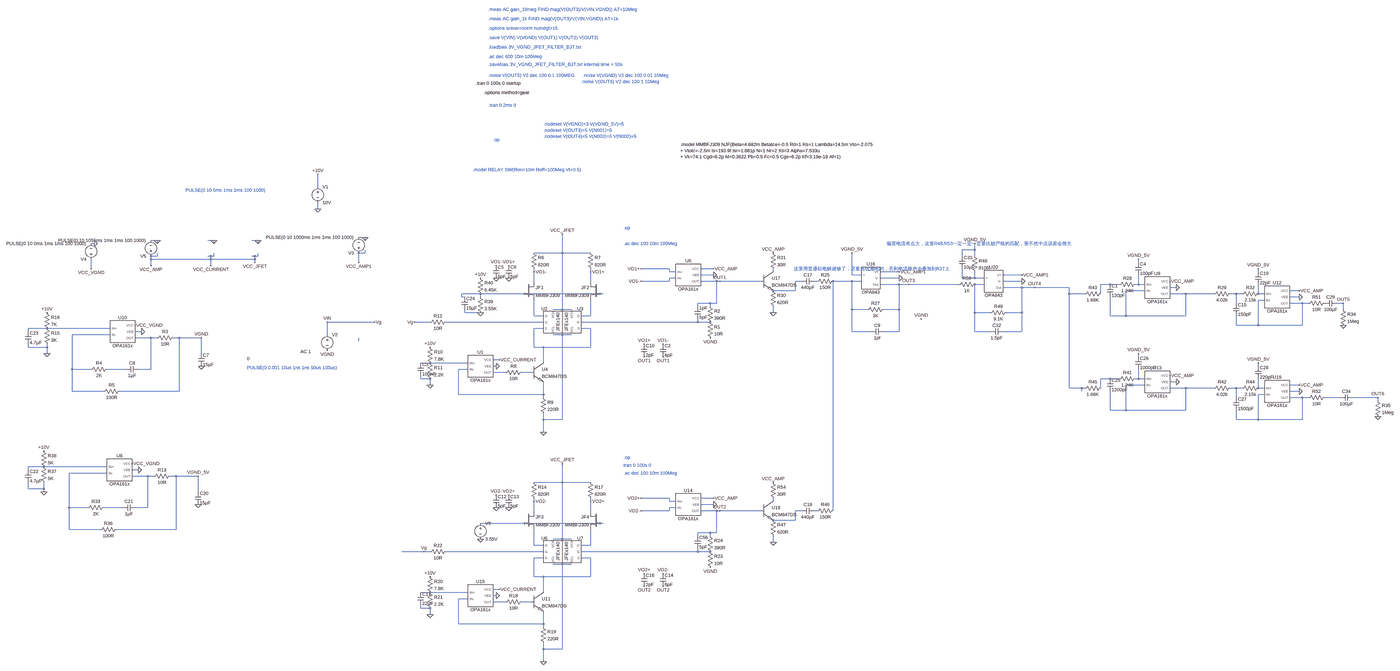
[diagram p0: schematic 3V_VGND__JFET_CASCODE_BJT.asc, whole sheet]
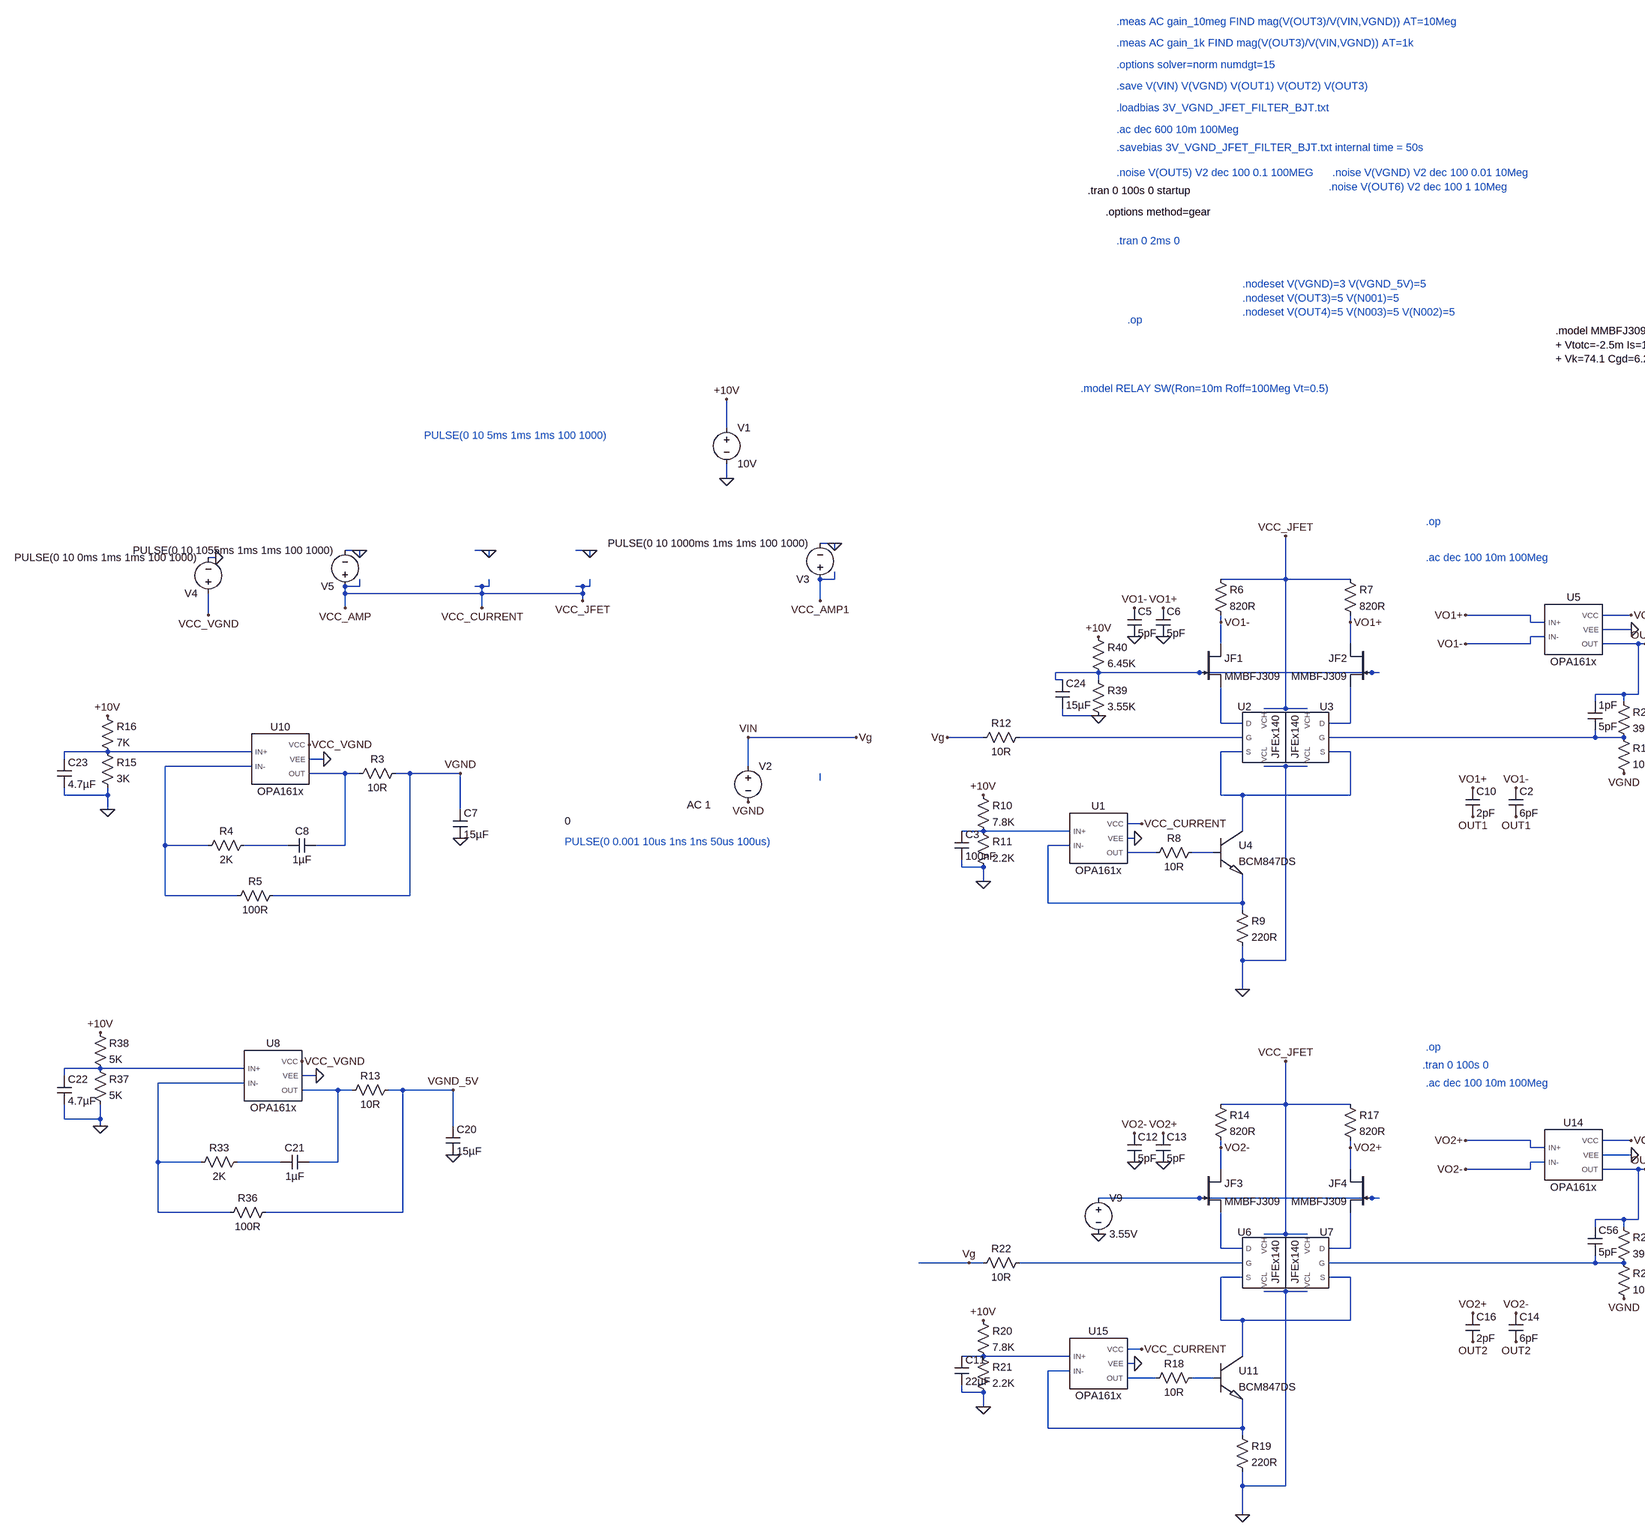
[diagram p1: schematic 3V_VGND__JFET_CASCODE_BJT.asc, part, row 1 of 1, column 1 of 2]
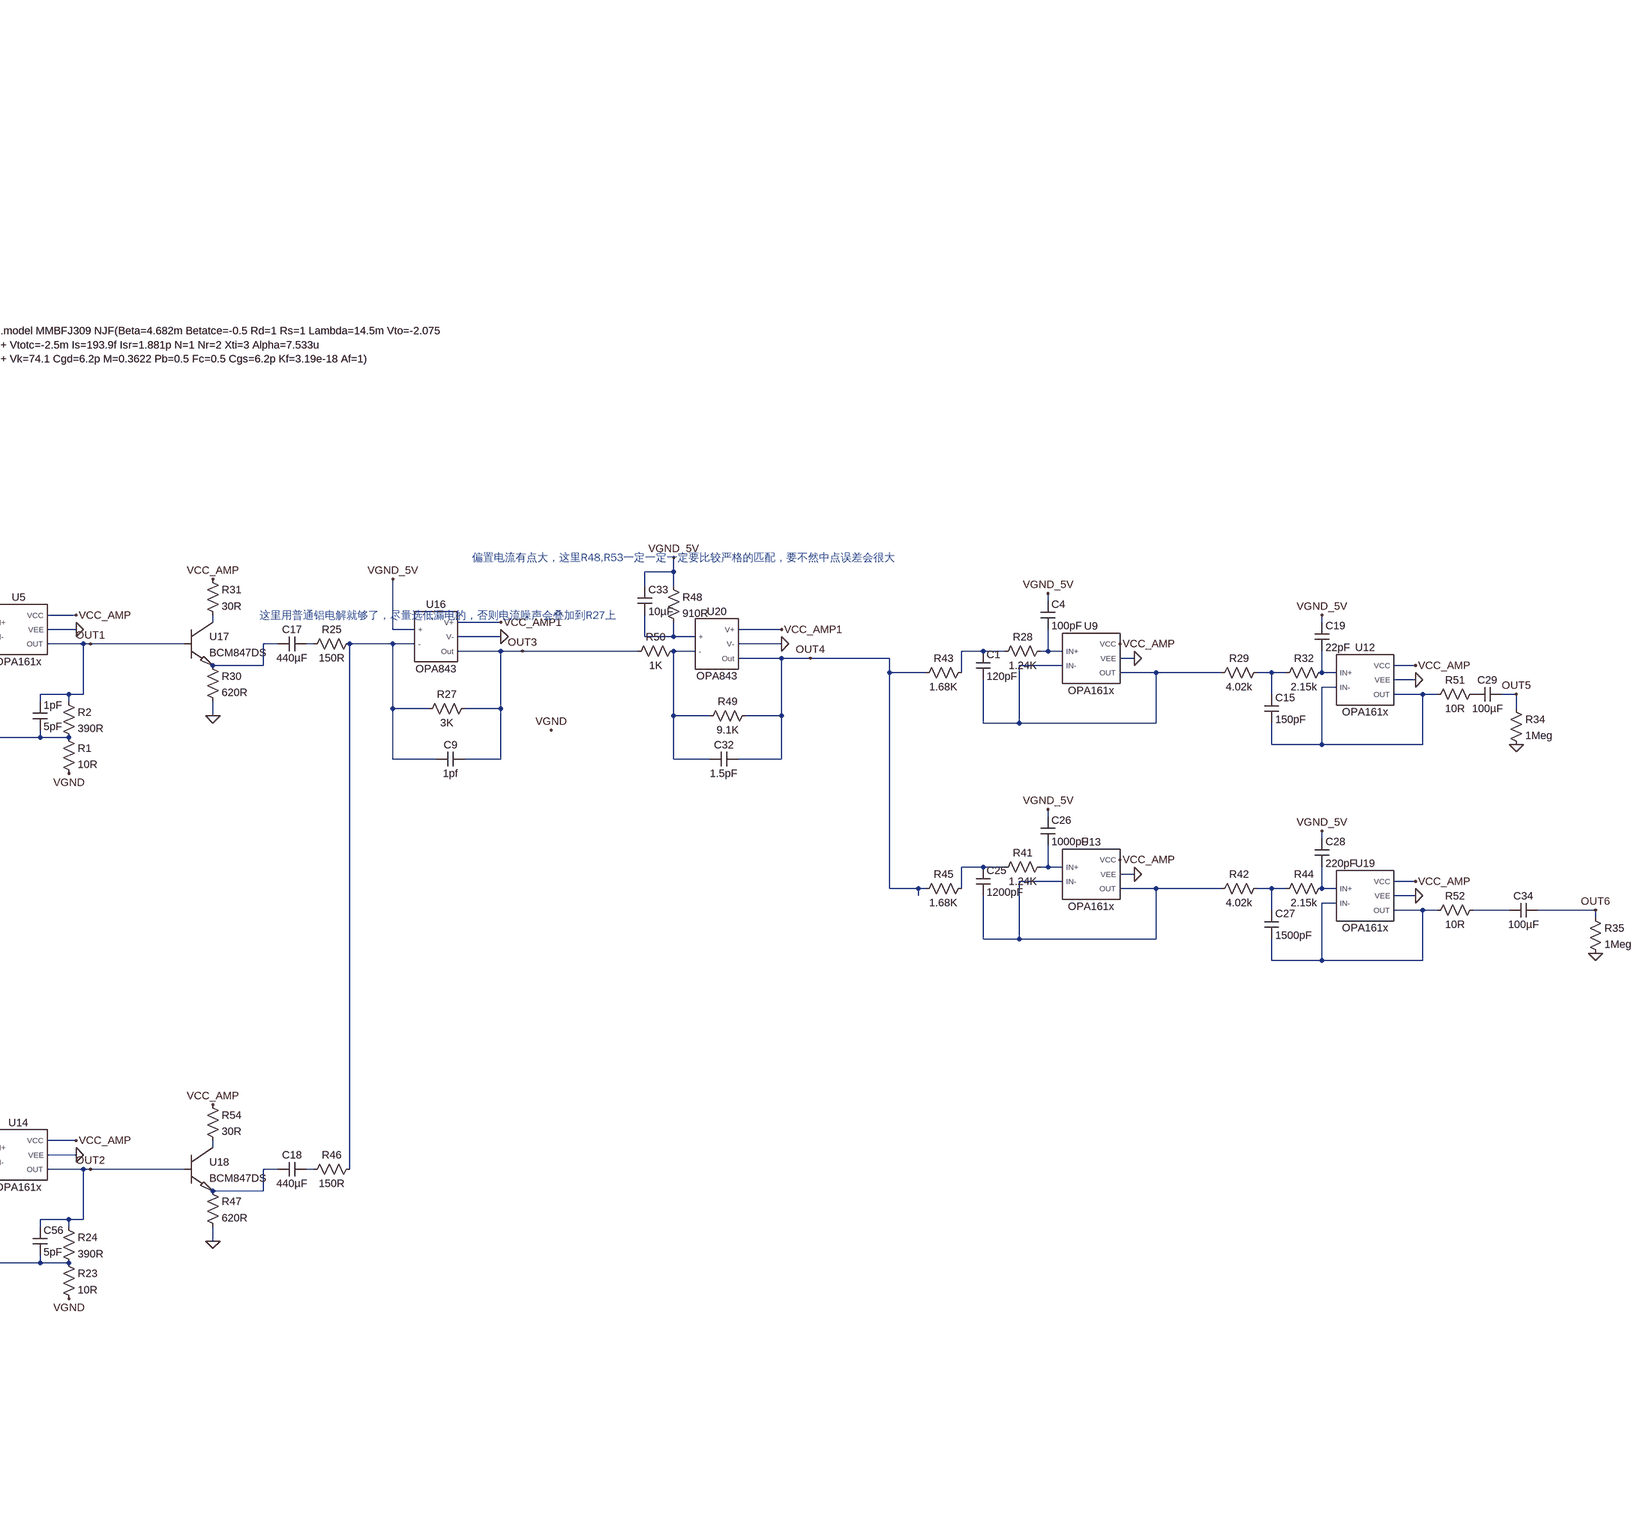
[diagram p2: schematic 3V_VGND__JFET_CASCODE_BJT.asc, part, row 1 of 1, column 2 of 2]
3V_VGND__JFET_CASCODE_BJT.asc, the LTspice schematic file:
Version 4.1
SHEET 1 3736 4404
WIRE -1888 -272 -1888 -336
WIRE -1888 -160 -1888 -192
WIRE -1648 -16 -1680 -16
WIRE -2704 0 -2736 0
WIRE -2416 0 -2448 0
WIRE -2192 0 -2224 0
WIRE -1648 0 -1648 -16
WIRE -3024 16 -3040 16
WIRE -2704 16 -2704 0
WIRE -2416 16 -2416 0
WIRE -2192 16 -2192 0
WIRE 1504 48 1504 16
WIRE 1504 48 1440 48
WIRE -1648 64 -1648 48
WIRE -1648 64 -1680 64
WIRE -592 64 -592 -32
WIRE -592 64 -736 64
WIRE -448 64 -592 64
WIRE -2704 80 -2704 64
WIRE -2704 80 -2736 80
WIRE -2432 80 -2448 80
WIRE -2416 80 -2416 64
WIRE -2416 80 -2432 80
WIRE -2208 80 -2224 80
WIRE -2192 80 -2192 64
WIRE -2192 80 -2208 80
WIRE 1440 80 1440 48
WIRE 1504 80 1504 48
WIRE -2736 96 -2736 80
WIRE -2432 96 -2432 80
WIRE -2432 96 -2736 96
WIRE -2208 96 -2208 80
WIRE -2208 96 -2432 96
WIRE -2208 112 -2208 96
WIRE -1680 112 -1680 64
WIRE 2336 112 2336 96
WIRE -2736 128 -2736 96
WIRE -2432 128 -2432 96
WIRE -3040 144 -3040 96
WIRE -48 144 -192 144
WIRE 176 144 112 144
WIRE -736 160 -736 144
WIRE -448 160 -448 144
WIRE -48 160 -48 144
WIRE -16 160 -48 160
WIRE 480 160 480 144
WIRE 1120 160 1024 160
WIRE 3040 160 3040 144
WIRE 176 176 112 176
WIRE 880 176 880 64
WIRE 928 176 880 176
WIRE 1744 176 1648 176
WIRE -16 192 -48 192
WIRE 1120 192 1024 192
WIRE 1440 192 1440 144
WIRE 1504 192 1504 160
WIRE 1504 192 1440 192
WIRE 1552 192 1504 192
WIRE -736 208 -736 160
WIRE -448 208 -448 160
WIRE -48 208 -48 192
WIRE -48 208 -192 208
WIRE 192 208 112 208
WIRE 208 208 192 208
WIRE 416 208 208 208
WIRE 624 208 592 208
WIRE 704 208 688 208
WIRE 880 208 784 208
WIRE 928 208 880 208
WIRE 1744 208 1648 208
WIRE 1120 224 1024 224
WIRE 1168 224 1120 224
WIRE 1424 224 1168 224
WIRE 1552 224 1504 224
WIRE 2192 224 2144 224
WIRE 2240 224 2192 224
WIRE 2336 224 2336 176
WIRE 2336 224 2320 224
WIRE 2368 224 2336 224
WIRE 1744 240 1648 240
WIRE 1808 240 1744 240
WIRE 1984 240 1808 240
WIRE 2528 240 2496 240
WIRE 592 256 592 208
WIRE 592 256 480 256
WIRE 2368 256 2272 256
WIRE 3248 256 3200 256
WIRE -1008 272 -1104 272
WIRE -784 272 -1008 272
WIRE -400 272 -784 272
WIRE -384 272 -400 272
WIRE 1984 272 1984 240
WIRE 2064 272 1984 272
WIRE 2144 272 2144 224
WIRE 2576 272 2496 272
WIRE 2816 272 2576 272
WIRE 2928 272 2896 272
WIRE 2960 272 2928 272
WIRE 3040 272 3040 224
WIRE 3072 272 3040 272
WIRE -1104 288 -1104 272
WIRE -1088 288 -1104 288
WIRE -1008 288 -1008 272
WIRE 3248 288 3200 288
WIRE 3072 304 3040 304
WIRE 160 320 96 320
WIRE 192 320 192 208
WIRE 192 320 160 320
WIRE 2928 320 2928 272
WIRE 3264 320 3200 320
WIRE 3296 320 3264 320
WIRE 3472 320 3440 320
WIRE 96 336 96 320
WIRE 160 336 160 320
WIRE -592 352 -592 64
WIRE -592 352 -640 352
WIRE -544 352 -592 352
WIRE 880 352 880 208
WIRE 960 352 880 352
WIRE 1120 352 1120 224
WIRE 1120 352 1040 352
WIRE 3472 352 3472 320
WIRE -1088 368 -1088 352
WIRE -1008 368 -1088 368
WIRE 480 368 480 336
WIRE 1504 368 1504 224
WIRE 1584 368 1504 368
WIRE 1744 368 1744 240
WIRE 1744 368 1664 368
WIRE -736 384 -736 304
WIRE -688 384 -736 384
WIRE -448 384 -448 304
WIRE -448 384 -496 384
WIRE 2192 384 2192 288
WIRE 2272 384 2272 256
WIRE 2272 384 2192 384
WIRE 2576 384 2576 272
WIRE 2576 384 2272 384
WIRE -1600 416 -1840 416
WIRE -1264 416 -1344 416
WIRE -688 416 -1184 416
WIRE 96 416 96 400
WIRE 96 416 -496 416
WIRE 160 416 96 416
WIRE 2928 432 2928 384
WIRE 3040 432 3040 304
WIRE 3040 432 2928 432
WIRE 3264 432 3264 320
WIRE 3264 432 3040 432
WIRE -3264 448 -3360 448
WIRE -2944 448 -3264 448
WIRE -688 448 -736 448
WIRE -448 448 -496 448
WIRE -3360 464 -3360 448
WIRE -2784 464 -2816 464
WIRE 880 464 880 352
WIRE 976 464 880 464
WIRE 1120 464 1120 352
WIRE 1120 464 1040 464
WIRE 1504 464 1504 368
WIRE 1584 464 1504 464
WIRE 1744 464 1744 368
WIRE 1744 464 1648 464
WIRE -2944 480 -3136 480
WIRE -1840 480 -1840 416
WIRE -592 480 -640 480
WIRE -544 480 -592 480
WIRE -2736 496 -2816 496
WIRE -2704 496 -2736 496
WIRE -2592 496 -2624 496
WIRE -2480 496 -2592 496
WIRE -1680 512 -1680 496
WIRE -3360 544 -3360 528
WIRE -3264 544 -3264 528
WIRE -3264 544 -3360 544
WIRE -736 544 -736 448
WIRE -688 544 -736 544
WIRE -448 544 -448 448
WIRE -448 544 -688 544
WIRE -3264 576 -3264 544
WIRE -2480 576 -2480 496
WIRE 2336 592 2336 576
WIRE -912 608 -944 608
WIRE -1264 624 -1312 624
WIRE -1072 624 -1264 624
WIRE -688 624 -688 544
WIRE -928 640 -944 640
WIRE 3040 640 3040 624
WIRE -3136 656 -3136 480
WIRE -3040 656 -3136 656
WIRE -2864 656 -2960 656
WIRE -2736 656 -2736 496
WIRE -2736 656 -2800 656
WIRE -1072 656 -1120 656
WIRE -880 672 -944 672
WIRE -752 672 -800 672
WIRE -1312 704 -1312 688
WIRE -1264 704 -1312 704
WIRE 2192 704 2144 704
WIRE 2240 704 2192 704
WIRE 2336 704 2336 656
WIRE 2336 704 2320 704
WIRE 2368 704 2336 704
WIRE 2528 720 2496 720
WIRE -1264 736 -1264 704
WIRE 2368 736 2272 736
WIRE 3248 736 3200 736
WIRE 1984 752 1984 272
WIRE 2048 752 1984 752
WIRE 2064 752 2048 752
WIRE 2144 752 2144 704
WIRE 2576 752 2496 752
WIRE 2816 752 2576 752
WIRE 2928 752 2896 752
WIRE 2960 752 2928 752
WIRE 3040 752 3040 704
WIRE 3072 752 3040 752
WIRE -3136 768 -3136 656
WIRE -2976 768 -3136 768
WIRE -2592 768 -2592 496
WIRE -2592 768 -2896 768
WIRE 2048 768 2048 752
WIRE 3248 768 3200 768
WIRE -1120 784 -1120 656
WIRE -688 784 -688 720
WIRE -688 784 -1120 784
WIRE 3072 784 3040 784
WIRE -688 800 -688 784
WIRE 2928 800 2928 752
WIRE 3264 800 3200 800
WIRE 3296 800 3264 800
WIRE 3456 800 3376 800
WIRE 3648 800 3520 800
WIRE 3648 816 3648 800
WIRE 2192 864 2192 768
WIRE 2272 864 2272 736
WIRE 2272 864 2192 864
WIRE 2576 864 2576 752
WIRE 2576 864 2272 864
WIRE -688 912 -688 880
WIRE -592 912 -592 480
WIRE -592 912 -688 912
WIRE 2928 912 2928 864
WIRE 3040 912 3040 784
WIRE 3040 912 2928 912
WIRE 3264 912 3264 800
WIRE 3264 912 3040 912
WIRE -688 976 -688 912
WIRE -3280 1152 -3360 1152
WIRE -2960 1152 -3280 1152
WIRE -3360 1168 -3360 1152
WIRE -2800 1168 -2832 1168
WIRE -2960 1184 -3152 1184
WIRE -2752 1200 -2832 1200
WIRE -2720 1200 -2752 1200
WIRE -2608 1200 -2640 1200
WIRE -2496 1200 -2608 1200
WIRE -592 1232 -592 1136
WIRE -592 1232 -736 1232
WIRE -448 1232 -592 1232
WIRE -3360 1264 -3360 1232
WIRE -3280 1264 -3280 1232
WIRE -3280 1264 -3360 1264
WIRE -3280 1280 -3280 1264
WIRE -2496 1280 -2496 1200
WIRE -48 1312 -192 1312
WIRE 176 1312 112 1312
WIRE -736 1328 -736 1312
WIRE -448 1328 -448 1312
WIRE -48 1328 -48 1312
WIRE -16 1328 -48 1328
WIRE 480 1328 480 1312
WIRE 176 1344 112 1344
WIRE -3152 1360 -3152 1184
WIRE -3056 1360 -3152 1360
WIRE -2880 1360 -2976 1360
WIRE -2752 1360 -2752 1200
WIRE -2752 1360 -2816 1360
WIRE -16 1360 -48 1360
WIRE -736 1376 -736 1328
WIRE -448 1376 -448 1328
WIRE -48 1376 -48 1360
WIRE -48 1376 -192 1376
WIRE 192 1376 112 1376
WIRE 208 1376 192 1376
WIRE 416 1376 208 1376
WIRE 624 1376 592 1376
WIRE 704 1376 688 1376
WIRE 784 1376 784 208
WIRE 592 1424 592 1376
WIRE 592 1424 480 1424
WIRE -784 1440 -1008 1440
WIRE -400 1440 -784 1440
WIRE -384 1440 -400 1440
WIRE -3152 1472 -3152 1360
WIRE -2992 1472 -3152 1472
WIRE -2608 1472 -2608 1200
WIRE -2608 1472 -2912 1472
WIRE 160 1488 96 1488
WIRE 192 1488 192 1376
WIRE 192 1488 160 1488
WIRE 96 1504 96 1488
WIRE 160 1504 160 1488
WIRE -592 1520 -592 1232
WIRE -592 1520 -640 1520
WIRE -544 1520 -592 1520
WIRE 480 1536 480 1504
WIRE -736 1552 -736 1472
WIRE -688 1552 -736 1552
WIRE -448 1552 -448 1472
WIRE -448 1552 -496 1552
WIRE -1296 1584 -1408 1584
WIRE -1264 1584 -1296 1584
WIRE -688 1584 -1184 1584
WIRE 96 1584 96 1568
WIRE 96 1584 -496 1584
WIRE 160 1584 96 1584
WIRE -688 1616 -736 1616
WIRE -448 1616 -496 1616
WIRE -592 1648 -640 1648
WIRE -544 1648 -592 1648
WIRE -736 1712 -736 1616
WIRE -688 1712 -736 1712
WIRE -448 1712 -448 1616
WIRE -448 1712 -688 1712
WIRE -912 1776 -944 1776
WIRE -1264 1792 -1312 1792
WIRE -1072 1792 -1264 1792
WIRE -688 1792 -688 1712
WIRE -928 1808 -944 1808
WIRE -1072 1824 -1120 1824
WIRE -880 1840 -944 1840
WIRE -752 1840 -800 1840
WIRE -1312 1872 -1312 1856
WIRE -1264 1872 -1312 1872
WIRE -1264 1904 -1264 1872
WIRE -1120 1952 -1120 1824
WIRE -688 1952 -688 1888
WIRE -688 1952 -1120 1952
WIRE -688 1968 -688 1952
WIRE -688 2080 -688 2048
WIRE -592 2080 -592 1648
WIRE -592 2080 -688 2080
WIRE -688 2144 -688 2080
FLAG -1888 -160 0
FLAG -1888 -336 +10V
FLAG -688 976 0
FLAG -1264 736 0
FLAG -1264 544 +10V
FLAG -928 640 0
FLAG -736 160 VO1-
FLAG -448 160 VO1+
FLAG -1840 416 VIN
FLAG -928 128 VO1-
FLAG -928 192 0
FLAG -864 128 VO1+
FLAG -864 192 0
FLAG -1008 368 0
FLAG -192 208 VO1-
FLAG -192 144 VO1+
FLAG -80 528 VO1-
FLAG 208 208 OUT1
FLAG -80 592 OUT1
FLAG 176 176 0
FLAG 160 496 VGND
FLAG 176 144 VCC_AMP
FLAG -2736 128 VCC_AMP
FLAG -2432 128 VCC_CURRENT
FLAG -2208 112 VCC_JFET
FLAG -592 -32 VCC_JFET
FLAG -912 608 VCC_CURRENT
FLAG -2704 0 0
FLAG -2416 0 0
FLAG -2192 0 0
FLAG -1840 560 VGND
FLAG -2480 640 0
FLAG -3040 144 VCC_VGND
FLAG -3024 16 0
FLAG -2816 432 VCC_VGND
FLAG -2784 464 0
FLAG -3264 576 0
FLAG -3264 368 +10V
FLAG -176 592 OUT1
FLAG -176 528 VO1+
FLAG -688 2144 0
FLAG -1264 1904 0
FLAG -1264 1712 +10V
FLAG -928 1808 0
FLAG -736 1328 VO2-
FLAG -448 1328 VO2+
FLAG -1296 1584 Vg
FLAG -928 1296 VO2-
FLAG -928 1360 0
FLAG -864 1296 VO2+
FLAG -864 1360 0
FLAG -1008 1520 0
FLAG -192 1376 VO2-
FLAG -192 1312 VO2+
FLAG -80 1696 VO2-
FLAG 208 1376 OUT2
FLAG -80 1760 OUT2
FLAG 176 1344 0
FLAG 160 1664 VGND
FLAG 176 1312 VCC_AMP
FLAG -592 1136 VCC_JFET
FLAG -912 1776 VCC_CURRENT
FLAG -176 1760 OUT2
FLAG -176 1696 VO2+
FLAG -1600 416 Vg
FLAG -1344 416 Vg
FLAG 880 64 VGND_5V
FLAG 1120 192 0
FLAG 1168 224 OUT3
FLAG -1680 112 VCC_AMP1
FLAG -1648 -16 0
FLAG 1120 160 VCC_AMP1
FLAG -2480 496 VGND
FLAG 2496 208 VCC_AMP
FLAG 2528 240 0
FLAG -2496 1344 0
FLAG -2832 1136 VCC_VGND
FLAG -2800 1168 0
FLAG -3280 1280 0
FLAG -3280 1072 +10V
FLAG -2496 1200 VGND_5V
FLAG -1008 192 +10V
FLAG 3248 288 0
FLAG 3248 256 VCC_AMP
FLAG 2496 688 VCC_AMP
FLAG 2528 720 0
FLAG 3248 768 0
FLAG 3248 736 VCC_AMP
FLAG 1504 16 VGND_5V
FLAG 1744 208 0
FLAG 1808 240 OUT4
FLAG 1744 176 VCC_AMP1
FLAG 2336 576 VGND_5V
FLAG 3040 624 VGND_5V
FLAG 3040 144 VGND_5V
FLAG 2336 96 VGND_5V
FLAG 3472 320 OUT5
FLAG 3648 800 OUT6
FLAG 3472 432 0
FLAG 1232 400 VGND
FLAG 3648 896 0
FLAG 480 368 0
FLAG 480 64 VCC_AMP
FLAG 480 1536 0
FLAG 480 1232 VCC_AMP
SYMBOL voltage -1888 -288 R0
WINDOW 123 0 0 Left 0
WINDOW 39 0 0 Left 0
SYMATTR InstName V1
SYMATTR Value 10V
SYMBOL JFEx140 -640 416 R0
SYMATTR InstName U2
SYMBOL JFEx140 -544 416 M0
SYMATTR InstName U3
SYMBOL res -752 48 R0
SYMATTR InstName R6
SYMATTR Value 820R
SYMBOL res -464 48 R0
SYMATTR InstName R7
SYMATTR Value 820R
SYMBOL BCM847DS -752 624 R0
SYMATTR InstName U4
SYMBOL res -784 656 R90
WINDOW 0 0 56 VBottom 2
WINDOW 3 32 56 VTop 2
SYMATTR InstName R8
SYMATTR Value 10R
SYMBOL res -704 784 R0
SYMATTR InstName R9
SYMATTR Value 220R
SYMBOL res -1280 528 R0
SYMATTR InstName R10
SYMATTR Value 7.8K
SYMBOL res -1280 608 R0
SYMATTR InstName R11
SYMATTR Value 2.2K
SYMBOL cap -1328 624 R0
SYMATTR InstName C3
SYMATTR Value 100nF
SYMBOL res -1168 400 R90
WINDOW 0 0 56 VBottom 2
WINDOW 3 32 56 VTop 2
SYMATTR InstName R12
SYMATTR Value 10R
SYMBOL voltage -1840 464 R0
WINDOW 3 -408 138 Left 2
WINDOW 123 -136 102 Left 2
WINDOW 39 0 0 Left 0
SYMATTR Value 0
SYMATTR Value2 AC 1
SYMATTR InstName V2
SYMBOL cap -944 128 R0
SYMATTR InstName C5
SYMATTR Value 5pF
SYMBOL cap -880 128 R0
SYMATTR InstName C6
SYMATTR Value 5pF
SYMBOL OPA161x 48 176 R0
SYMATTR InstName U5
SYMBOL cap -96 528 R0
SYMATTR InstName C2
SYMATTR Value 6pF
SYMBOL res 144 400 R0
SYMATTR InstName R1
SYMATTR Value 10R
SYMBOL res 144 320 R0
SYMATTR InstName R2
SYMATTR Value 390R
SYMBOL cap 80 336 R0
SYMATTR InstName 1pF
SYMATTR Value 5pF
SYMBOL OPA161x -1008 640 R0
SYMATTR InstName U1
SYMBOL OPA161x -2880 464 R0
SYMATTR InstName U10
SYMBOL res -2608 480 R90
WINDOW 0 0 56 VBottom 2
WINDOW 3 32 56 VTop 2
SYMATTR InstName R3
SYMATTR Value 10R
SYMBOL cap -2496 576 R0
SYMATTR InstName C7
SYMATTR Value 15µF
SYMATTR SpiceLine Rser=10mR Lser=1nH
SYMBOL cap -2800 640 R90
WINDOW 0 0 32 VBottom 2
WINDOW 3 32 32 VTop 2
SYMATTR InstName C8
SYMATTR Value 1µF
SYMBOL res -2944 640 R90
WINDOW 0 0 56 VBottom 2
WINDOW 3 32 56 VTop 2
SYMATTR InstName R4
SYMATTR Value 2K
SYMBOL res -2880 752 R90
WINDOW 0 0 56 VBottom 2
WINDOW 3 32 56 VTop 2
SYMATTR InstName R5
SYMATTR Value 100R
SYMBOL res -3280 432 R0
SYMATTR InstName R15
SYMATTR Value 3K
SYMBOL res -3280 352 R0
SYMATTR InstName R16
SYMATTR Value 7K
SYMBOL cap -192 528 R0
SYMATTR InstName C10
SYMATTR Value 2pF
SYMBOL JFEx140 -640 1584 R0
SYMATTR InstName U6
SYMBOL JFEx140 -544 1584 M0
SYMATTR InstName U7
SYMBOL res -752 1216 R0
SYMATTR InstName R14
SYMATTR Value 820R
SYMBOL res -464 1216 R0
SYMATTR InstName R17
SYMATTR Value 820R
SYMBOL BCM847DS -752 1792 R0
SYMATTR InstName U11
SYMBOL res -784 1824 R90
WINDOW 0 0 56 VBottom 2
WINDOW 3 32 56 VTop 2
SYMATTR InstName R18
SYMATTR Value 10R
SYMBOL res -704 1952 R0
SYMATTR InstName R19
SYMATTR Value 220R
SYMBOL res -1280 1696 R0
SYMATTR InstName R20
SYMATTR Value 7.8K
SYMBOL res -1280 1776 R0
SYMATTR InstName R21
SYMATTR Value 2.2K
SYMBOL cap -1328 1792 R0
SYMATTR InstName C11
SYMATTR Value 22µF
SYMBOL res -1168 1568 R90
WINDOW 0 0 56 VBottom 2
WINDOW 3 32 56 VTop 2
SYMATTR InstName R22
SYMATTR Value 10R
SYMBOL cap -944 1296 R0
SYMATTR InstName C12
SYMATTR Value 5pF
SYMBOL cap -880 1296 R0
SYMATTR InstName C13
SYMATTR Value 5pF
SYMBOL voltage -1008 1424 R0
WINDOW 123 0 0 Left 0
WINDOW 39 0 0 Left 0
SYMATTR InstName V9
SYMATTR Value 3.55V
SYMBOL OPA161x 48 1344 R0
SYMATTR InstName U14
SYMBOL cap -96 1696 R0
SYMATTR InstName C14
SYMATTR Value 6pF
SYMBOL res 144 1568 R0
SYMATTR InstName R23
SYMATTR Value 10R
SYMBOL res 144 1488 R0
SYMATTR InstName R24
SYMATTR Value 390R
SYMBOL cap 80 1504 R0
SYMATTR InstName C56
SYMATTR Value 5pF
SYMBOL OPA161x -1008 1808 R0
SYMATTR InstName U15
SYMBOL cap -192 1696 R0
SYMATTR InstName C16
SYMATTR Value 2pF
SYMBOL res 800 192 R90
WINDOW 0 0 56 VBottom 2
WINDOW 3 32 56 VTop 2
SYMATTR InstName R25
SYMATTR Value 150R
SYMBOL res 1056 336 R90
WINDOW 0 0 56 VBottom 2
WINDOW 3 32 56 VTop 2
SYMATTR InstName R27
SYMATTR Value 3K
SYMBOL OPA843 976 192 R0
SYMATTR InstName U16
SYMBOL cap 1040 448 R90
WINDOW 0 0 32 VBottom 2
WINDOW 3 32 32 VTop 2
SYMATTR InstName C9
SYMATTR Value 1pf
SYMBOL njf -784 208 R0
SYMATTR InstName JF1
SYMATTR Value MMBFJ309
SYMBOL njf -400 208 M0
SYMATTR InstName JF2
SYMATTR Value MMBFJ309
SYMBOL njf -784 1376 R0
SYMATTR InstName JF3
SYMATTR Value MMBFJ309
SYMBOL njf -400 1376 M0
SYMATTR InstName JF4
SYMATTR Value MMBFJ309
SYMBOL cap 2176 224 R0
SYMATTR InstName C1
SYMATTR Value 120pF
SYMBOL res 2336 208 R90
WINDOW 0 0 56 VBottom 2
WINDOW 3 32 56 VTop 2
SYMATTR InstName R28
SYMATTR Value 1.24K
SYMBOL cap 2320 112 R0
SYMATTR InstName C4
SYMATTR Value 100pF
SYMBOL res 2912 256 R90
WINDOW 0 0 56 VBottom 2
WINDOW 3 32 56 VTop 2
SYMATTR InstName R29
SYMATTR Value 4.02k
SYMBOL res 3056 256 R90
WINDOW 0 0 56 VBottom 2
WINDOW 3 32 56 VTop 2
SYMATTR InstName R32
SYMATTR Value 2.15k
SYMBOL cap 2912 320 R0
SYMATTR InstName C15
SYMATTR Value 150pF
SYMBOL cap 3024 160 R0
SYMATTR InstName C19
SYMATTR Value 22pF
SYMBOL OPA161x -2896 1168 R0
SYMATTR InstName U8
SYMBOL res -2624 1184 R90
WINDOW 0 0 56 VBottom 2
WINDOW 3 32 56 VTop 2
SYMATTR InstName R13
SYMATTR Value 10R
SYMBOL cap -2512 1280 R0
SYMATTR InstName C20
SYMATTR Value 15µF
SYMATTR SpiceLine Rser=10mR Lser=1nH
SYMBOL cap -2816 1344 R90
WINDOW 0 0 32 VBottom 2
WINDOW 3 32 32 VTop 2
SYMATTR InstName C21
SYMATTR Value 1µF
SYMBOL res -2960 1344 R90
WINDOW 0 0 56 VBottom 2
WINDOW 3 32 56 VTop 2
SYMATTR InstName R33
SYMATTR Value 2K
SYMBOL res -2896 1456 R90
WINDOW 0 0 56 VBottom 2
WINDOW 3 32 56 VTop 2
SYMATTR InstName R36
SYMATTR Value 100R
SYMBOL res -3296 1136 R0
SYMATTR InstName R37
SYMATTR Value 5K
SYMBOL res -3296 1056 R0
SYMATTR InstName R38
SYMATTR Value 5K
SYMBOL cap -3376 1168 R0
SYMATTR InstName C22
SYMATTR Value 4.7µF
SYMBOL cap -3376 464 R0
SYMATTR InstName C23
SYMATTR Value 4.7µF
SYMBOL res -1024 272 R0
SYMATTR InstName R39
SYMATTR Value 3.55K
SYMBOL cap -1104 288 R0
SYMATTR InstName C24
SYMATTR Value 15µF
SYMBOL res -1024 176 R0
SYMATTR InstName R40
SYMATTR Value 6.45K
SYMBOL OPA161x 2432 240 R0
SYMATTR InstName U9
SYMBOL OPA161x 3136 288 R0
SYMATTR InstName U12
SYMBOL res 2160 256 R90
WINDOW 0 0 56 VBottom 2
WINDOW 3 32 56 VTop 2
SYMATTR InstName R43
SYMATTR Value 1.68K
SYMBOL cap 2176 704 R0
SYMATTR InstName C25
SYMATTR Value 1200pF
SYMBOL res 2336 688 R90
WINDOW 0 0 56 VBottom 2
WINDOW 3 32 56 VTop 2
SYMATTR InstName R41
SYMATTR Value 1.24K
SYMBOL cap 2320 592 R0
SYMATTR InstName C26
SYMATTR Value 1000pF
SYMBOL res 2912 736 R90
WINDOW 0 0 56 VBottom 2
WINDOW 3 32 56 VTop 2
SYMATTR InstName R42
SYMATTR Value 4.02k
SYMBOL res 3056 736 R90
WINDOW 0 0 56 VBottom 2
WINDOW 3 32 56 VTop 2
SYMATTR InstName R44
SYMATTR Value 2.15k
SYMBOL cap 2912 800 R0
SYMATTR InstName C27
SYMATTR Value 1500pF
SYMBOL cap 3024 640 R0
SYMATTR InstName C28
SYMATTR Value 220pF
SYMBOL OPA161x 2432 720 R0
SYMATTR InstName U13
SYMBOL OPA161x 3136 768 R0
SYMATTR InstName U19
SYMBOL res 2160 736 R90
WINDOW 0 0 56 VBottom 2
WINDOW 3 32 56 VTop 2
SYMATTR InstName R45
SYMATTR Value 1.68K
SYMBOL cap 3440 304 R90
WINDOW 0 0 32 VBottom 2
WINDOW 3 32 32 VTop 2
SYMATTR InstName C29
SYMATTR Value 100µF
SYMBOL res 1680 352 R90
WINDOW 0 0 56 VBottom 2
WINDOW 3 32 56 VTop 2
SYMATTR InstName R49
SYMATTR Value 9.1K
SYMBOL res 1520 208 R90
WINDOW 0 0 56 VBottom 2
WINDOW 3 32 56 VTop 2
SYMATTR InstName R50
SYMATTR Value 1K
SYMBOL res 3392 304 R90
WINDOW 0 0 56 VBottom 2
WINDOW 3 32 56 VTop 2
SYMATTR InstName R51
SYMATTR Value 10R
SYMBOL res 3392 784 R90
WINDOW 0 0 56 VBottom 2
WINDOW 3 32 56 VTop 2
SYMATTR InstName R52
SYMATTR Value 10R
SYMBOL res 1488 64 R0
SYMATTR InstName R48
SYMATTR Value 910R
SYMBOL OPA843 1600 208 R0
SYMATTR InstName U20
SYMBOL cap 1648 448 R90
WINDOW 0 0 32 VBottom 2
WINDOW 3 32 32 VTop 2
SYMATTR InstName C32
SYMATTR Value 1.5pF
SYMBOL cap 1424 80 R0
SYMATTR InstName C33
SYMATTR Value 10µF
SYMBOL res 3456 336 R0
SYMATTR InstName R34
SYMATTR Value 1Meg
SYMBOL cap 3520 784 R90
WINDOW 0 0 32 VBottom 2
WINDOW 3 32 32 VTop 2
SYMATTR InstName C34
SYMATTR Value 100µF
SYMBOL res 3632 800 R0
SYMATTR InstName R35
SYMATTR Value 1Meg
SYMBOL BCM847DS 416 160 R0
SYMATTR InstName U17
SYMBOL res 464 240 R0
SYMATTR InstName R30
SYMATTR Value 620R
SYMBOL res 464 48 R0
SYMATTR InstName R31
SYMATTR Value 30R
SYMBOL cap 688 192 R90
WINDOW 0 0 32 VBottom 2
WINDOW 3 32 32 VTop 2
SYMATTR InstName C17
SYMATTR Value 440µF
SYMBOL res 800 1360 R90
WINDOW 0 0 56 VBottom 2
WINDOW 3 32 56 VTop 2
SYMATTR InstName R46
SYMATTR Value 150R
SYMBOL BCM847DS 416 1328 R0
SYMATTR InstName U18
SYMBOL res 464 1408 R0
SYMATTR InstName R47
SYMATTR Value 620R
SYMBOL res 464 1216 R0
SYMATTR InstName R54
SYMATTR Value 30R
SYMBOL cap 688 1360 R90
WINDOW 0 0 32 VBottom 2
WINDOW 3 32 32 VTop 2
SYMATTR InstName C18
SYMATTR Value 440µF
SYMBOL voltage -3040 112 R180
WINDOW 123 0 0 Left 0
WINDOW 39 0 0 Left 0
SYMATTR InstName V4
SYMATTR Value PULSE(0 10 0ms 1ms 1ms 100 1000)
SYMBOL voltage -1680 80 R180
WINDOW 123 0 0 Left 0
WINDOW 39 0 0 Left 0
SYMATTR InstName V3
SYMATTR Value PULSE(0 10 1000ms 1ms 1ms 100 1000)
SYMBOL voltage -2736 96 R180
WINDOW 123 0 0 Left 0
WINDOW 39 0 0 Left 0
SYMATTR InstName V5
SYMATTR Value PULSE(0 10 1055ms 1ms 1ms 100 1000)
TEXT -280 16 Left 2 ;.ac dec 100 10m 100Meg
TEXT -1032 -800 Left 2 !.tran 0 100s 0 startup
TEXT -280 -64 Left 2 ;.op
TEXT -944 -512 Left 2 ;.op
TEXT -1048 -360 Left 2 ;.model RELAY SW(Ron=10m Roff=100Meg Vt=0.5)
TEXT -968 -840 Left 2 ;.noise V(OUT5) V2 dec 100 0.1 100MEG
TEXT -280 1184 Left 2 ;.ac dec 100 10m 100Meg
TEXT -288 1144 Left 2 ;.tran 0 100s 0
TEXT -280 1104 Left 2 ;.op
TEXT -968 -936 Left 2 ;.ac dec 600 10m 100Meg
TEXT -968 -984 Left 2 ;.loadbias 3V_VGND_JFET_FILTER_BJT.txt
TEXT -968 -1032 Left 2 ;.save V(VIN) V(VGND) V(OUT1) V(OUT2) V(OUT3)
TEXT -968 -1080 Left 2 ;.options solver=norm numdgt=15
TEXT -968 -1128 Left 2 ;.meas AC gain_1k FIND mag(V(OUT3)/V(VIN,VGND)) AT=1k
TEXT -968 -1176 Left 2 ;.meas AC gain_10meg FIND mag(V(OUT3)/V(VIN,VGND)) AT=10Meg
TEXT -968 -896 Left 2 ;.savebias 3V_VGND_JFET_FILTER_BJT.txt internal time = 50s
TEXT 8 -488 Left 2 !.model MMBFJ309 NJF(Beta=4.682m Betatce=-0.5 Rd=1 Rs=1 Lambda=14.5m Vto=-2.075\n+ Vtotc=-2.5m Is=193.9f Isr=1.881p N=1 Nr=2 Xti=3 Alpha=7.533u\n+ Vk=74.1 Cgd=6.2p M=0.3622 Pb=0.5 Fc=0.5 Cgs=6.2p Kf=3.19e-18 Af=1)
TEXT -2560 -256 Left 2 ;PULSE(0 10 5ms 1ms 1ms 100 1000)
TEXT -992 -752 Left 2 !.options method=gear
TEXT -968 -688 Left 2 ;.tran 0 2ms 0
TEXT -2248 648 Left 2 ;PULSE(0 0.001 10us 1ns 1ns 50us 100us)
TEXT -688 -592 Left 2 ;.nodeset V(VGND)=3 V(VGND_5V)=5\n.nodeset V(OUT3)=5 V(N001)=5\n.nodeset V(OUT4)=5 V(N003)=5 V(N002)=5
TEXT -488 -840 Left 2 ;.noise V(VGND) V2 dec 100 0.01 10Meg
TEXT -496 -808 Left 2 ;.noise V(OUT6) V2 dec 100 1 10Meg
TEXT 1056 16 Left 2 ;偏置电流有点大，这里R48,R53一定一定一定要比较严格的匹配，要不然中点误差会很大
TEXT 584 144 Left 2 ;这里用普通铝电解就够了，尽量选低漏电的，否则电流噪声会叠加到R27上

The netlist it stands for:
* 3V_VGND__JFET_CASCODE_BJT.asc
V1 +10V 0 10V
X§U2 N014 N016 N019 VCC_JFET 0 JFEx140  ; pins D G S VCH VCL
X§U3 N015 N017 N019 VCC_JFET 0 JFEx140  ; pins D G S VCH VCL
R6 VCC_JFET VO1- 820R
R7 VCC_JFET VO1+ 820R
X§U4 N019 N027 N025 BCM847DS  ; pins C B E
R8 N027 N026 10R
R9 N025 0 220R
R10 +10V N023 7.8K
R11 N023 0 2.2K
C3 N023 0 100nF
R12 N016 Vg 10R
V2 Vg VGND 0 AC 1
C5 VO1- 0 5pF
C6 VO1+ 0 5pF
X§U5 VO1+ VO1- VCC_JFET 0 OUT1 OPA161x  ; pins IN+ IN- VCC VEE OUT
C2 VO1- OUT1 6pF
R1 N017 VGND 10R
R2 OUT1 N017 390R
C§1pF OUT1 N017 5pF
X§U1 N023 N025 VCC_JFET 0 N026 OPA161x  ; pins IN+ IN- VCC VEE OUT
X§U10 N018 N020 VCC_VGND 0 N021 OPA161x  ; pins IN+ IN- VCC VEE OUT
R3 VGND N021 10R
C7 VGND 0 15µF Rser=10mR Lser=1nH
C8 N021 N024 1µF
R4 N024 N020 2K
R5 VGND N020 100R
R15 N018 0 3K
R16 +10V N018 7K
C10 VO1+ OUT1 2pF
X§U6 N043 N045 N047 VCC_JFET 0 JFEx140  ; pins D G S VCH VCL
X§U7 N044 N046 N047 VCC_JFET 0 JFEx140  ; pins D G S VCH VCL
R14 VCC_JFET VO2- 820R
R17 VCC_JFET VO2+ 820R
X§U11 N047 N051 N049 BCM847DS  ; pins C B E
R18 N051 N050 10R
R19 N049 0 220R
R20 +10V N048 7.8K
R21 N048 0 2.2K
C11 N048 0 22µF
R22 N045 Vg 10R
C12 VO2- 0 5pF
C13 VO2+ 0 5pF
V9 N042 0 3.55V
X§U14 VO2+ VO2- VCC_JFET 0 OUT2 OPA161x  ; pins IN+ IN- VCC VEE OUT
C14 VO2- OUT2 6pF
R23 N046 VGND 10R
R24 OUT2 N046 390R
C56 OUT2 N046 5pF
X§U15 N048 N049 VCC_JFET 0 N050 OPA161x  ; pins IN+ IN- VCC VEE OUT
C16 VO2+ OUT2 2pF
R25 N005 N004 150R
R27 OUT3 N005 3K
X§U16 VGND_5V N005 VCC_AMP1 0 OUT3 OPA843  ; pins + - V+ V- Out
C9 OUT3 N005 1pf
JF1 VO1- N010 N014 MMBFJ309
JF2 VO1+ N010 N015 MMBFJ309
JF3 VO2- N042 N043 MMBFJ309
JF4 VO2+ N042 N044 MMBFJ309
C1 N007 N009 120pF
R28 N008 N007 1.24K
C4 VGND_5V N008 100pF
R29 N011 N009 4.02k
R32 N012 N011 2.15k
C15 N011 N013 150pF
C19 VGND_5V N012 22pF
X§U8 N035 N036 VCC_VGND 0 N037 OPA161x  ; pins IN+ IN- VCC VEE OUT
R13 VGND_5V N037 10R
C20 VGND_5V 0 15µF Rser=10mR Lser=1nH
C21 N037 N039 1µF
R33 N039 N036 2K
R36 VGND_5V N036 100R
R37 N035 0 5K
R38 +10V N035 5K
C22 N035 0 4.7µF
C23 N018 0 4.7µF
R39 N010 0 3.55K
C24 N010 0 15µF
R40 +10V N010 6.45K
X§U9 N008 N009 VCC_JFET 0 N009 OPA161x  ; pins IN+ IN- VCC VEE OUT
X§U12 N012 N013 VCC_JFET 0 N013 OPA161x  ; pins IN+ IN- VCC VEE OUT
R43 N007 OUT4 1.68K
C25 N028 N030 1200pF
R41 N029 N028 1.24K
C26 VGND_5V N029 1000pF
R42 N031 N030 4.02k
R44 N032 N031 2.15k
C27 N031 N033 1500pF
C28 VGND_5V N032 220pF
X§U13 N029 N030 VCC_JFET 0 N030 OPA161x  ; pins IN+ IN- VCC VEE OUT
X§U19 N032 N033 VCC_JFET 0 N033 OPA161x  ; pins IN+ IN- VCC VEE OUT
R45 N028 OUT4 1.68K
C29 OUT5 P001 100µF
R49 OUT4 N006 9.1K
R50 N006 OUT3 1K
R51 P001 N013 10R
R52 N034 N033 10R
R48 VGND_5V N002 910R
X§U20 N002 N006 VCC_AMP1 0 OUT4 OPA843  ; pins + - V+ V- Out
C32 OUT4 N006 1.5pF
C33 VGND_5V N002 10µF
R34 OUT5 0 1Meg
C34 OUT6 N034 100µF
R35 OUT6 0 1Meg
X§U17 N001 OUT1 N003 BCM847DS  ; pins C B E
R30 N003 0 620R
R31 VCC_JFET N001 30R
C17 N004 N003 440µF
R46 N005 N041 150R
X§U18 N038 OUT2 N040 BCM847DS  ; pins C B E
R47 N040 0 620R
R54 VCC_JFET N038 30R
C18 N041 N040 440µF
V4 VCC_VGND 0 PULSE(0 10 0ms 1ms 1ms 100 1000)
V3 VCC_AMP1 0 PULSE(0 10 1000ms 1ms 1ms 100 1000)
V5 VCC_JFET 0 PULSE(0 10 1055ms 1ms 1ms 100 1000)
.model NJF NJF
.model PJF PJF
.lib standard.jft
* .ac dec 100 10m 100Meg
.tran 0 100s 0 startup
* .op
* .op
* .model RELAY SW(Ron=10m Roff=100Meg Vt=0.5)
* .noise V(OUT5) V2 dec 100 0.1 100MEG
* .ac dec 100 10m 100Meg
* .tran 0 100s 0
* .op
* .ac dec 600 10m 100Meg
* .loadbias 3V_VGND_JFET_FILTER_BJT.txt
* .save V(VIN) V(VGND) V(OUT1) V(OUT2) V(OUT3)
* .options solver=norm numdgt=15
* .meas AC gain_1k FIND mag(V(OUT3)/V(VIN,VGND)) AT=1k
* .meas AC gain_10meg FIND mag(V(OUT3)/V(VIN,VGND)) AT=10Meg
* .savebias 3V_VGND_JFET_FILTER_BJT.txt internal time = 50s
.model MMBFJ309 NJF(Beta=4.682m Betatce=-0.5 Rd=1 Rs=1 Lambda=14.5m Vto=-2.075
+ Vtotc=-2.5m Is=193.9f Isr=1.881p N=1 Nr=2 Xti=3 Alpha=7.533u
+ Vk=74.1 Cgd=6.2p M=0.3622 Pb=0.5 Fc=0.5 Cgs=6.2p Kf=3.19e-18 Af=1)
* PULSE(0 10 5ms 1ms 1ms 100 1000)
.options method=gear
* .tran 0 2ms 0
* PULSE(0 0.001 10us 1ns 1ns 50us 100us)
* .nodeset V(VGND)=3 V(VGND_5V)=5
* .nodeset V(OUT3)=5 V(N001)=5
* .nodeset V(OUT4)=5 V(N003)=5 V(N002)=5
* .noise V(VGND) V2 dec 100 0.01 10Meg
* .noise V(OUT6) V2 dec 100 1 10Meg
* 偏置电流有点大，这里R48,R53一定一定一定要比较严格的匹配，要不然中点误差会很大
* 这里用普通铝电解就够了，尽量选低漏电的，否则电流噪声会叠加到R27上
.lib jfex140.lib
.lib BCM847.lib
.lib OPA161x.LIB
.lib OPA843_LT2410.lib
.backanno
.end